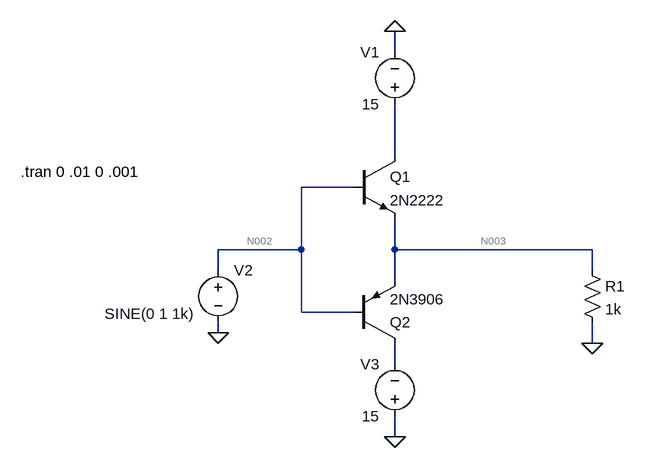
[diagram p0: schematic Draft4.asc]
Draft4.asc, the LTspice schematic file:
Version 4.1
SHEET 1 880 680
WIRE 464 -96 464 -128
WIRE 464 64 464 -16
WIRE 400 112 320 112
WIRE 320 208 320 112
WIRE 320 208 192 208
WIRE 464 208 464 160
WIRE 768 208 464 208
WIRE 192 240 192 208
WIRE 768 240 768 208
WIRE 464 256 464 208
WIRE 320 304 320 208
WIRE 400 304 320 304
WIRE 192 336 192 320
WIRE 768 352 768 320
WIRE 464 384 464 352
WIRE 464 496 464 464
FLAG 768 352 0
FLAG 464 -128 0
FLAG 192 336 0
FLAG 464 496 0
SYMBOL npn 400 64 R0
SYMATTR InstName Q1
SYMATTR Value 2N2222
SYMBOL res 752 224 R0
SYMATTR InstName R1
SYMATTR Value 1k
SYMBOL voltage 464 0 R180
WINDOW 0 24 96 Left 2
WINDOW 3 24 16 Left 2
WINDOW 123 0 0 Left 0
WINDOW 39 0 0 Left 0
SYMATTR InstName V1
SYMATTR Value 15
SYMBOL voltage 192 224 R0
WINDOW 3 -175 83 Left 2
WINDOW 123 0 0 Left 0
WINDOW 39 0 0 Left 0
SYMATTR InstName V2
SYMATTR Value SINE(0 1 1k)
SYMBOL pnp 400 352 M180
SYMATTR InstName Q2
SYMATTR Value 2N3906
SYMBOL voltage 464 480 R180
WINDOW 0 24 96 Left 2
WINDOW 3 24 16 Left 2
WINDOW 123 0 0 Left 0
WINDOW 39 0 0 Left 0
SYMATTR InstName V3
SYMATTR Value 15
TEXT -112 88 Left 2 !.tran 0 .01 0 .001

The netlist it stands for:
* Draft4.asc
Q1 N001 N002 N003 0 2N2222
R1 N003 0 1k
V1 N001 0 15
V2 N002 0 SINE(0 1 1k)
Q2 N004 N002 N003 0 2N3906
V3 0 N004 15
.model NPN NPN
.model PNP PNP
.lib standard.bjt
.tran 0 .01 0 .001
.backanno
.end

* Results of the author's LTspice run, read from the files saved beside the schematic
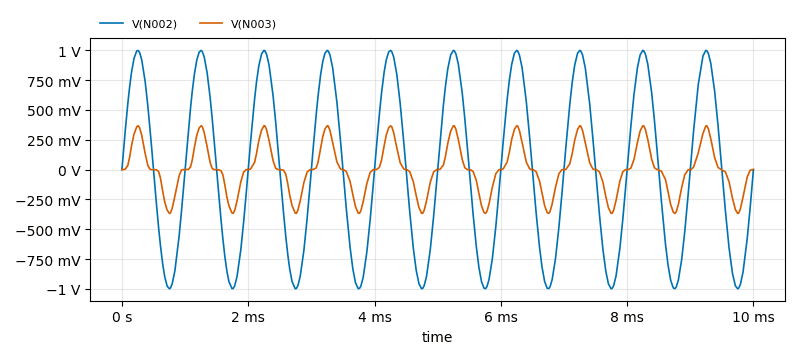
[diagram p1: Transient Analysis of Draft4.asc, plotted from the saved traces]
* Transient Analysis, 1 run:
*   V(N002): min -1 V, max 1 V, average -32.68 µV, rms 708.2 mV, last 0 V
*   V(N003): min -368.2 mV, max 368.2 mV, average -683.9 µV, rms 205.6 mV, last 222.1 µV